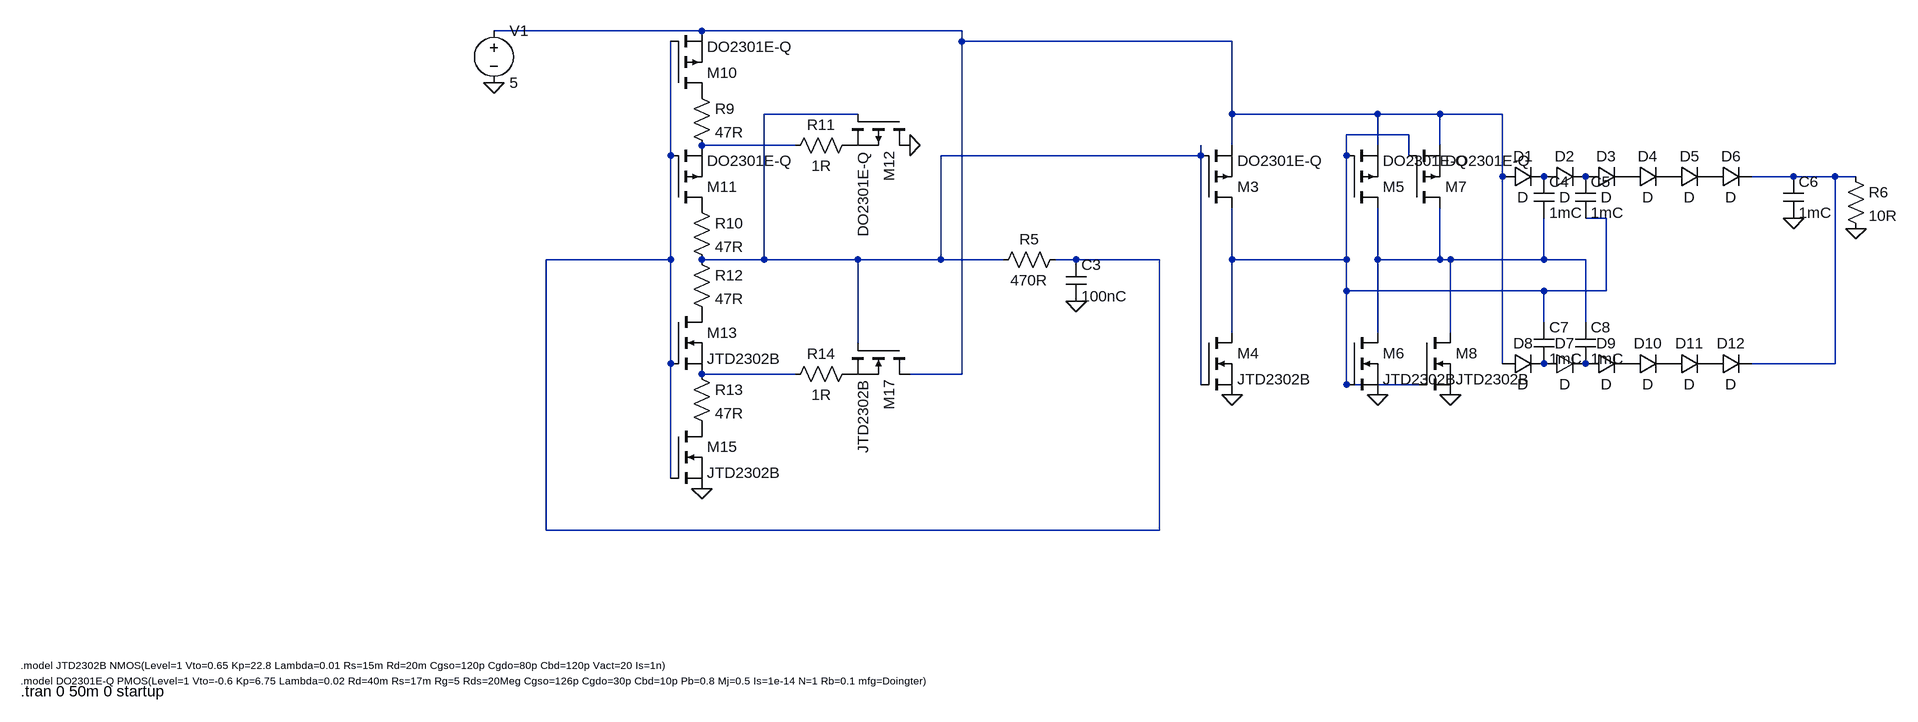
[diagram p0: schematic powermanagement.asc]
powermanagement.asc, the LTspice schematic file:
Version 4.1
SHEET 1 2516 680
WIRE 672 -432 352 -432
WIRE 1072 -432 672 -432
WIRE 1072 -416 1072 -432
WIRE 1488 -416 1072 -416
WIRE 912 -304 768 -304
WIRE 1488 -304 1488 -416
WIRE 1712 -304 1488 -304
WIRE 1808 -304 1712 -304
WIRE 1904 -304 1808 -304
WIRE 1760 -272 1664 -272
WIRE 816 -256 672 -256
WIRE 1488 -256 1488 -304
WIRE 1712 -256 1712 -304
WIRE 1808 -256 1808 -304
WIRE 624 -240 624 -416
WIRE 1440 -240 1440 -256
WIRE 1440 -240 1040 -240
WIRE 1664 -240 1664 -272
WIRE 1760 -240 1760 -272
WIRE 1904 -208 1904 -304
WIRE 2352 -208 2288 -208
WIRE 2416 -208 2352 -208
WIRE 2448 -208 2416 -208
WIRE 2064 -144 2032 -144
WIRE 624 -80 624 -240
WIRE 624 -80 432 -80
WIRE 768 -80 768 -304
WIRE 768 -80 672 -80
WIRE 912 -80 768 -80
WIRE 1040 -80 1040 -240
WIRE 1040 -80 912 -80
WIRE 1136 -80 1040 -80
WIRE 1248 -80 1216 -80
WIRE 1376 -80 1248 -80
WIRE 1488 -80 1488 -160
WIRE 1664 -80 1664 -240
WIRE 1664 -80 1488 -80
WIRE 1712 -80 1712 -160
WIRE 1808 -80 1808 -160
WIRE 1808 -80 1712 -80
WIRE 1824 -80 1808 -80
WIRE 1968 -80 1968 -144
WIRE 1968 -80 1824 -80
WIRE 2032 -80 1968 -80
WIRE 1664 -32 1664 -80
WIRE 1968 -32 1664 -32
WIRE 2064 -32 2064 -144
WIRE 2064 -32 1968 -32
WIRE 1968 16 1968 -32
WIRE 2032 16 2032 -80
WIRE 1488 32 1488 -80
WIRE 1712 32 1712 -80
WIRE 1824 32 1824 -80
WIRE 912 48 912 -80
WIRE 624 80 624 -80
WIRE 1904 80 1904 -208
WIRE 2416 80 2416 -208
WIRE 2416 80 2288 80
WIRE 816 96 672 96
WIRE 1072 96 1072 -416
WIRE 1072 96 992 96
WIRE 1440 112 1440 -240
WIRE 1664 112 1664 -32
WIRE 1776 112 1664 112
WIRE 624 256 624 80
WIRE 432 336 432 -80
WIRE 1376 336 1376 -80
WIRE 1376 336 432 336
FLAG 352 -352 0
FLAG 992 -256 0
FLAG 672 272 0
FLAG 1248 -16 0
FLAG 1488 128 0
FLAG 1712 128 0
FLAG 1824 128 0
FLAG 2448 -128 0
FLAG 2352 -144 0
SYMBOL voltage 352 -448 R0
WINDOW 123 0 0 Left 0
WINDOW 39 0 0 Left 0
SYMATTR InstName V1
SYMATTR Value 5
SYMBOL pmos 624 -336 M180
SYMATTR InstName M10
SYMATTR Value DO2301E-Q
SYMBOL res 656 -352 R0
SYMATTR InstName R9
SYMATTR Value 47R
SYMBOL pmos 624 -160 M180
SYMATTR InstName M11
SYMATTR Value DO2301E-Q
SYMBOL res 656 -176 R0
SYMATTR InstName R10
SYMATTR Value 47R
SYMBOL pmos 992 -304 R90
SYMATTR InstName M12
SYMATTR Value DO2301E-Q
SYMBOL res 912 -272 R90
WINDOW 0 0 56 VBottom 2
WINDOW 3 32 56 VTop 2
SYMATTR InstName R11
SYMATTR Value 1R
SYMBOL res 656 -96 R0
SYMATTR InstName R12
SYMATTR Value 47R
SYMBOL nmos 624 0 R0
SYMATTR InstName M13
SYMATTR Value JTD2302B
SYMBOL res 656 80 R0
SYMATTR InstName R13
SYMATTR Value 47R
SYMBOL nmos 624 176 R0
SYMATTR InstName M15
SYMATTR Value JTD2302B
SYMBOL nmos 992 48 R90
SYMATTR InstName M17
SYMATTR Value JTD2302B
SYMBOL res 912 80 R90
WINDOW 0 0 56 VBottom 2
WINDOW 3 32 56 VTop 2
SYMATTR InstName R14
SYMATTR Value 1R
SYMBOL res 1232 -96 R90
WINDOW 0 0 56 VBottom 2
WINDOW 3 32 56 VTop 2
SYMATTR InstName R5
SYMATTR Value 470R
SYMBOL cap 1232 -80 R0
SYMATTR InstName C3
SYMATTR Value 100nC
SYMBOL pmos 1440 -160 M180
SYMATTR InstName M3
SYMATTR Value DO2301E-Q
SYMBOL nmos 1440 32 R0
SYMATTR InstName M4
SYMATTR Value JTD2302B
SYMBOL pmos 1664 -160 M180
SYMATTR InstName M5
SYMATTR Value DO2301E-Q
SYMBOL nmos 1664 32 R0
SYMATTR InstName M6
SYMATTR Value JTD2302B
SYMBOL diode 1968 -192 R270
WINDOW 0 32 32 VTop 2
WINDOW 3 0 32 VBottom 2
SYMATTR InstName D2
SYMBOL cap 1952 -208 R0
SYMATTR InstName C4
SYMATTR Value 1mC
SYMBOL cap 2016 -208 R0
SYMATTR InstName C5
SYMATTR Value 1mC
SYMBOL diode 1904 -192 R270
WINDOW 0 32 32 VTop 2
WINDOW 3 0 32 VBottom 2
SYMATTR InstName D1
SYMBOL pmos 1760 -160 M180
SYMATTR InstName M7
SYMATTR Value DO2301E-Q
SYMBOL nmos 1776 32 R0
SYMATTR InstName M8
SYMATTR Value JTD2302B
SYMBOL diode 2032 -192 R270
WINDOW 0 32 32 VTop 2
WINDOW 3 0 32 VBottom 2
SYMATTR InstName D3
SYMBOL diode 2096 -192 R270
WINDOW 0 32 32 VTop 2
WINDOW 3 0 32 VBottom 2
SYMATTR InstName D4
SYMBOL diode 2160 -192 R270
WINDOW 0 32 32 VTop 2
WINDOW 3 0 32 VBottom 2
SYMATTR InstName D5
SYMBOL cap 2336 -208 R0
SYMATTR InstName C6
SYMATTR Value 1mC
SYMBOL res 2432 -224 R0
SYMATTR InstName R6
SYMATTR Value 10R
SYMBOL diode 1968 64 M90
WINDOW 0 0 32 VBottom 2
WINDOW 3 32 32 VTop 2
SYMATTR InstName D7
SYMBOL cap 1952 80 M180
WINDOW 0 24 56 Left 2
WINDOW 3 24 8 Left 2
SYMATTR InstName C7
SYMATTR Value 1mC
SYMBOL cap 2016 80 M180
WINDOW 0 24 56 Left 2
WINDOW 3 24 8 Left 2
SYMATTR InstName C8
SYMATTR Value 1mC
SYMBOL diode 1904 64 M90
WINDOW 0 0 32 VBottom 2
WINDOW 3 32 32 VTop 2
SYMATTR InstName D8
SYMBOL diode 2032 64 M90
WINDOW 0 0 32 VBottom 2
WINDOW 3 32 32 VTop 2
SYMATTR InstName D9
SYMBOL diode 2096 64 M90
WINDOW 0 0 32 VBottom 2
WINDOW 3 32 32 VTop 2
SYMATTR InstName D10
SYMBOL diode 2160 64 M90
WINDOW 0 0 32 VBottom 2
WINDOW 3 32 32 VTop 2
SYMATTR InstName D11
SYMBOL diode 2224 -192 R270
WINDOW 0 32 32 VTop 2
WINDOW 3 0 32 VBottom 2
SYMATTR InstName D6
SYMBOL diode 2224 64 M90
WINDOW 0 0 32 VBottom 2
WINDOW 3 32 32 VTop 2
SYMATTR InstName D12
TEXT -376 544 Left 1 !.model JTD2302B NMOS(Level=1 Vto=0.65 Kp=22.8 Lambda=0.01 Rs=15m Rd=20m Cgso=120p Cgdo=80p Cbd=120p Vact=20 Is=1n)
TEXT -376 568 Left 1 !.model DO2301E-Q PMOS(Level=1 Vto=-0.6 Kp=6.75 Lambda=0.02 Rd=40m Rs=17m Rg=5 Rds=20Meg Cgso=126p Cgdo=30p Cbd=10p Pb=0.8 Mj=0.5 Is=1e-14 N=1 Rb=0.1 mfg=Doingter)
TEXT -376 584 Left 2 !.tran 0 50m 0 startup

The netlist it stands for:
* powermanagement.asc
V1 N001 0 5
M10 P001 N005 N001 N001 DO2301E-Q
R9 P001 N004 47R
M11 P002 N005 N004 N004 DO2301E-Q
R10 P002 N002 47R
M12 0 N002 P003 P003 DO2301E-Q
R11 P003 N004 1R
R12 N002 P004 47R
M13 P004 N005 N008 N008 JTD2302B
R13 N008 P005 47R
M15 P005 N005 0 0 JTD2302B
M17 N001 N002 P006 P006 JTD2302B
R14 P006 N008 1R
R5 N005 N002 470R
C3 N005 0 100nC
M3 N003 N002 N001 N001 DO2301E-Q
M4 N003 N002 0 0 JTD2302B
M5 N007 N003 N001 N001 DO2301E-Q
M6 N007 N003 0 0 JTD2302B
D2 P007 P008 D
C4 P007 N007 1mC
C5 P008 N003 1mC
D1 N001 P007 D
M7 N007 N003 N001 N001 DO2301E-Q
M8 N007 N003 0 0 JTD2302B
D3 P008 P009 D
D4 P009 P010 D
D5 P010 P011 D
C6 N006 0 1mC
R6 N006 0 10R
D7 P012 P013 D
C7 P012 N003 1mC
C8 P013 N007 1mC
D8 N001 P012 D
D9 P013 P014 D
D10 P014 P015 D
D11 P015 P016 D
D6 P011 N006 D
D12 P016 N006 D
.model D D
.lib standard.dio
.model NMOS NMOS
.model PMOS PMOS
.lib standard.mos
.model JTD2302B NMOS(Level=1 Vto=0.65 Kp=22.8 Lambda=0.01 Rs=15m Rd=20m Cgso=120p Cgdo=80p Cbd=120p Vact=20 Is=1n)
.model DO2301E-Q PMOS(Level=1 Vto=-0.6 Kp=6.75 Lambda=0.02 Rd=40m Rs=17m Rg=5 Rds=20Meg Cgso=126p Cgdo=30p Cbd=10p Pb=0.8 Mj=0.5 Is=1e-14 N=1 Rb=0.1 mfg=Doingter)
.tran 0 50m 0 startup
.backanno
.end